# Altium schematic sheet IoT_Uni_Term_Schematic.SchDoc
size A4; SheetNumber: 1; SheetTotal: 1; SPICEModelCachePMUXJGOG: <root> / <DocumentId>PMUXJGOG</DocumentId> / </root>
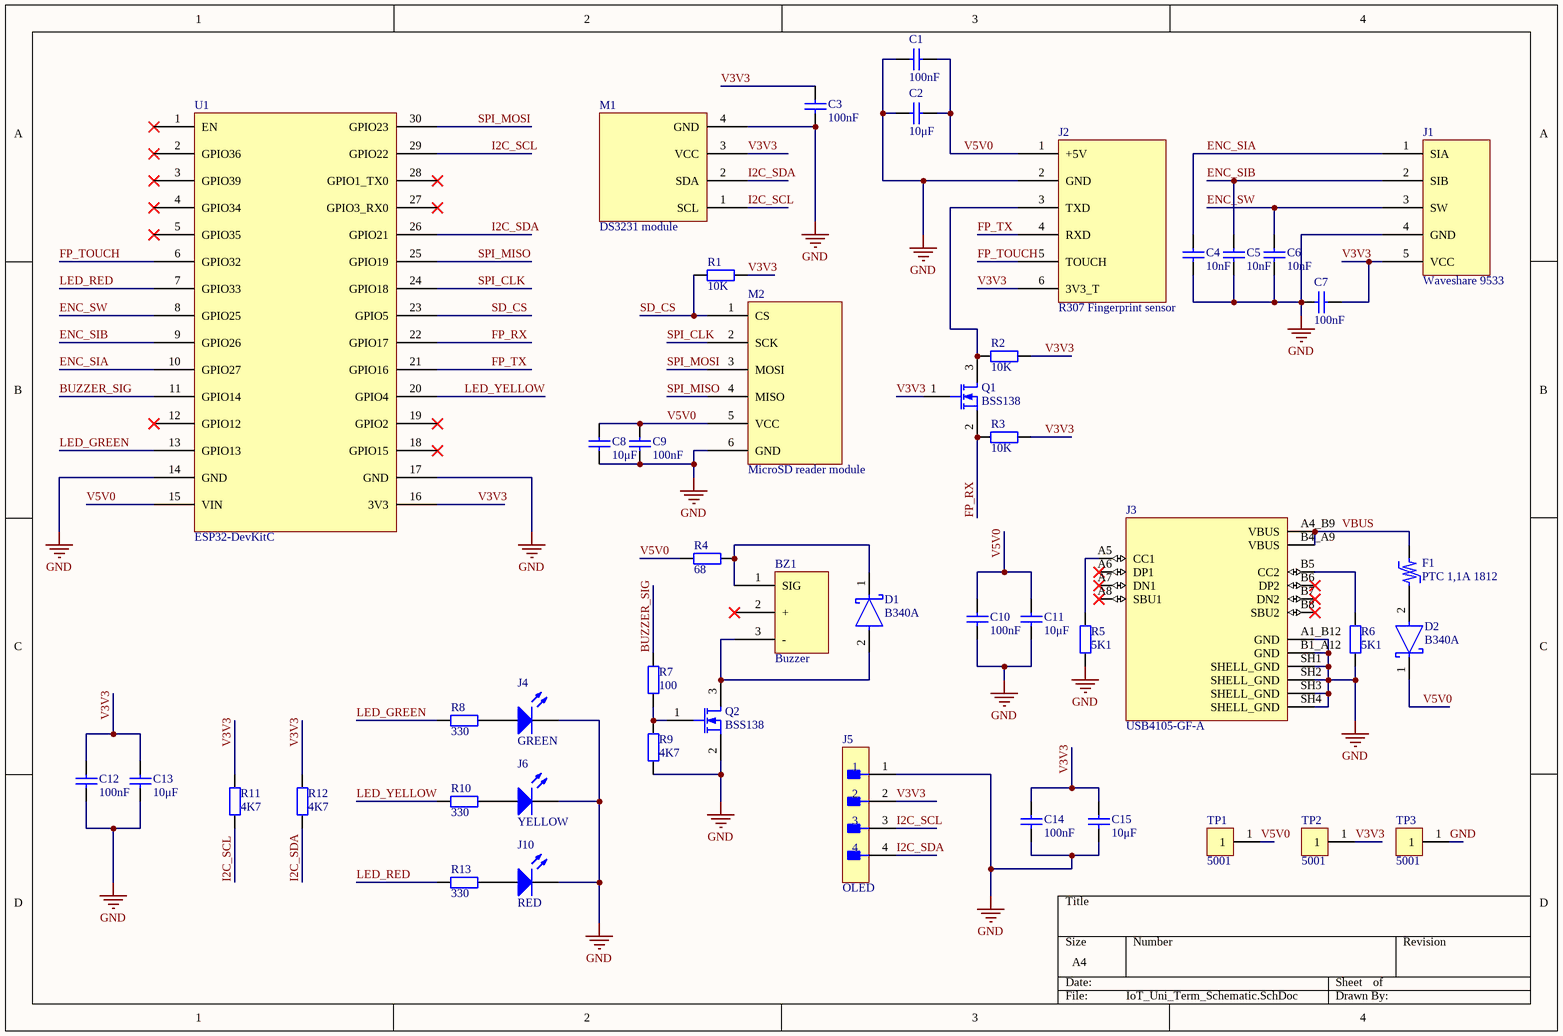
[diagram p0: IoT_Uni_Term_Schematic.SchDoc]

## Parts
BZ1  Buzzer  [BUZZER_HW508]
C1  100nF  [Capacitor_FP-C1206C-EB-IPC_B]
C2  10μF  [Capacitor_FP-C1206C-EB-IPC_B]
C3  100nF  [Capacitor_FP-C1206C-EB-IPC_B]
C4  10nF  [Capacitor_FP-C1206C-EB-IPC_B]
C5  10nF  [Capacitor_FP-C1206C-EB-IPC_B]
C6  10nF  [Capacitor_FP-C1206C-EB-IPC_B]
C7  100nF  [Capacitor_FP-C1206C-EB-IPC_B]
C8  10μF  [Capacitor_FP-C1206C-EB-IPC_B]
C9  100nF  [Capacitor_FP-C1206C-EB-IPC_B]
C10  100nF  [Capacitor_FP-C1206C-EB-IPC_B]
C11  10μF  [Capacitor_FP-C1206C-EB-IPC_B]
C12  100nF  [Capacitor_FP-C1206C-EB-IPC_B]
C13  10μF  [Capacitor_FP-C1206C-EB-IPC_B]
C14  100nF  [Capacitor_FP-C1206C-EB-IPC_B]
C15  10μF  [Capacitor_FP-C1206C-EB-IPC_B]
D1  B340A  [FP-SMA-MFG]
D2  B340A  [FP-SMA-MFG]
F1  PTC 1,1A 1812  [BOUR-MF-MSMF110-24X-2_V]
J1  Waveshare 9533  [FP-B5B-XH-A_LF_SN-MFG]
J2  R307 Fingerprint sensor  [FP-B6B-XH-A_LF_SN-MFG]
J3  USB4105-GF-A  [GCT_USB4105-GF-A]
J4  GREEN  [FP-B2B-XH-A_LF_SN-MFG]
J5  OLED  [FP-B4B-XH-A_LF_SN-MFG]
J6  YELLOW  [FP-B2B-XH-A_LF_SN-MFG]
J10  RED  [FP-B2B-XH-A_LF_SN-MFG]
M1  DS3231 module  [DS3231_MODUL]
M2  MicroSD reader module  [MICROSD_MODUL]
Q1  BSS138  [BSS138]
Q2  BSS138  [BSS138]
R1  10K  [RESISTOR 1206]
R2  10K  [RESISTOR 1206]
R3  10K  [RESISTOR 1206]
R4  68  [RESISTOR 1206]
R5  5K1  [RESISTOR 1206]
R6  5K1  [RESISTOR 1206]
R7  100  [RESISTOR 1206]
R8  330  [RESISTOR 1206]
R9  4K7  [RESISTOR 1206]
R10  330  [RESISTOR 1206]
R11  4K7  [RESISTOR 1206]
R12  4K7  [RESISTOR 1206]
R13  330  [RESISTOR 1206]
TP1  5001  [FP-5001-MFG]
TP2  5001  [FP-5001-MFG]
TP3  5001  [FP-5001-MFG]
U1  ESP32-DevKitC  [ESP32_DevKitC_WROOM-32_15x2PIN]

## Nets
GND: C1.1 C2.1 C3.1 C4.1 C5.1 C6.1 C7.1 C8.1 C9.1 C10.1 C11.1 C12.1 C13.1 C14.1 C15.1 J1.4(GND) J2.2(GND) J3.A1_B12(GND) J3.B1_A12(GND) J3.SH1(SHELL_GND) J3.SH2(SHELL_GND) J3.SH3(SHELL_GND) J3.SH4(SHELL_GND) J4.2(K) J5.1 J6.2(K) J10.2(K) M1.4(GND) M2.6(GND) Q2.2(S) R5.1 R6.1 R9.1 TP3.1 U1.14(GND) U1.17(GND)
BUZZER_SIG: R7.2 U1.11(GPIO14)
ENC_SIA: C4.2 J1.1(SIA) U1.10(GPIO27)
ENC_SIB: C5.2 J1.2(SIB) U1.9(GPIO26)
ENC_SW: C6.2 J1.3(SW) U1.8(GPIO25)
FP_RX: Q1.2(S) R3.1 U1.22(GPIO17)
FP_TOUCH: J2.5(TOUCH) U1.6(GPIO32)
FP_TX: J2.4(RXD) U1.21(GPIO16)
I2C_SCL: J5.3 M1.1(SCL) R11.1 U1.29(GPIO22)
I2C_SDA: J5.4 M1.2(SDA) R12.1 U1.26(GPIO21)
LED_GREEN: R8.2 U1.13(GPIO13)
LED_RED: R13.2 U1.7(GPIO33)
LED_YELLOW: R10.2 U1.20(GPIO4)
SD_CS: M2.1(CS) R1.1 U1.23(GPIO5)
SPI_CLK: M2.2(SCK) U1.24(GPIO18)
SPI_MISO: M2.4(MISO) U1.25(GPIO19)
SPI_MOSI: M2.3(MOSI) U1.30(GPIO23)
V3V3: C3.2 C7.2 C12.2 C13.2 C14.2 C15.2 J1.5(VCC) J2.6(3V3_T) J5.2 M1.3(VCC) Q1.1(G) R1.2 R2.2 R3.2 R11.2 R12.2 TP2.1 U1.16(3V3)
V5V0: C1.2 C2.2 C8.2 C9.2 C10.2 C11.2 D2.1(C) J2.1(+5V) M2.5(VCC) R4.1 TP1.1 U1.15(VIN)
VBUS: F1.1 J3.A4_B9(VBUS) J3.B4_A9(VBUS)
NetBZ1_1: BZ1.1(SIG) D1.1(C) R4.2
NetBZ1_3: BZ1.3(-) D1.2(A) Q2.3(D)
NetD2_2: D2.2(A) F1.2
NetJ2_3: J2.3(TXD) Q1.3(D) R2.1
NetJ3_A5: J3.A5(CC1) R5.2
NetJ3_B5: J3.B5(CC2) R6.2
NetJ4_1: J4.1(A) R8.1
NetJ6_1: J6.1(A) R10.1
NetJ10_1: J10.1(A) R13.1
NetQ2_1: Q2.1(G) R7.1 R9.2

Not connected (* = marked no-connect by the designer): BZ1 2(+)*; J3 A6(DP1)* A7(DN1)* A8(SBU1)* B6(DP2)* B7(DN2)* B8(SBU2)*; U1 1(EN)* 2(GPIO36)* 3(GPIO39)* 4(GPIO34)* 5(GPIO35)* 12(GPIO12)* 18(GPIO15)* 19(GPIO2)* 27(GPIO3_RX0)* 28(GPIO1_TX0)*

## Library data of the parts
BZ1 = Buzzer: positive, negative terminals + input signal
C1-C15 = Cap: Capacitor; Published: 8-Jun-2000; LatestRevisionDate: 17-Jul-2002; LatestRevisionNote: Re-released for DXP Platform.; PackageReference: RAD-0.3; Publisher: Altium Limited; PackageDescription: Radial Cap, Thru-Hole; 2 Leads; 0.3 in Pin Spacing
  C1 C3 C7 C9 C10 C12 C14: Value: 100nF
  C2 C8 C11 C13 C15: Value: 10μF
  C4-C6: Value: 10nF
D1 D2 = CMP-1667-00003-3: DIODE SCHOTTKY 40V 3A SMA; Max Forward Surge Current (Ifsm): 80A; Forward Voltage: 500mV; Polarity: Standard; Max Reverse Current: 500uA; Capacitance: 250pF; Element Configuration: Single; Mount: Surface Mount; Output Current: 3A; Radiation Hardening: No; Width: 2.92mm; Current Rating: 3A; Termination: SMD/SMT; Voltage: 40V; Series: -; Max Operating Temperature: 125°C; Current: 3A; Max Repetitive Reverse Voltage (Vrrm): 40V; Min Operating Temperature: -55°C; REACH SVHC: No SVHC; Number of Pins: 2; Average Rectified Current: 3A; Contact Plating: Tin; RoHS Compliant: Yes; Max Reverse Voltage (DC): 40V; Packaging: Tape and Reel; Height: 2.3mm; Length: 4.6mm; Case/Package: SMA; Weight: 0.002258oz; Peak Non-Repetitive Surge Current: 80A; Package Quantity: 5000; Lead Free: Lead Free; Forward Current: 3A; Voltage Rating (DC): 40V
F1 = CMP-2100-03655-1: PTC Resettable Fuse, 24 V, 1.1 A, -40 to 85 degC, 2-Pin SMD, RoHS, Tape and Reel; Manufacturer: Bourns; Max Current Rating: 20A; Power Dissipation: 800mW; Supply Voltage: 24V; Number of Terminals: 2; Max Operating Temperature: 85degC; Case Code (Metric): 4532; Width: 3.41mm; RoHSCompliant: true; Contact Plating: Gold; Package Reference: MF-MSMF110-24X-2; Min Operating Temperature: -40degC; Packaging: TapeandReel; Mount: SurfaceMount; Case Code (Imperial): 1812; Length: 4.83mm; Height: 1.6mm; Case/Package: 1812; Datasheet URL: http://www.bourns.com/docs/Product-Datasheets/mfmsmf.pdf; Datasheet Version: Rev. AG, 08/2016; Voltage Rating: 24V; REACH SVHC: NoSVHC; Voltage Rating (DC): 24V; Radiation Hardening: No; Package Description: 2-Pin Surface Mount Device, Body 4.6 x 3.24 mm; Manufacturer URL: http://www.bourns.com/
J1 = Waveshare 9533: compact rotary encoder module featuring a built-in button, designed to detect clockwise and anti-clockwise rotation for menu navigation, volume control, or motor positioning
J2 = GROW R307S: optical fingerprint sensor module from Hangzhou Grow Technology Co., Ltd. It features a high-speed DSP processor, flash memory for storage
J3 = USB4105-GF-A: MF: {'manufacturer': u'GCT'}; Package: None; Price: None; Value: *; MP: USB4105-GF-A; Availability: Unavailable
J4 J6 J10 = LED2: Typical RED, GREEN, YELLOW, AMBER GaAs LED; Published: 8-Jun-2000; LatestRevisionDate: 17-Jul-2002; LatestRevisionNote: Re-released for DXP Platform.; PackageVersion: Feb-2002; PackageReference: 3.2X1.6X1.1; Publisher: Altium Limited; PackageDescription: SM LED; 2 Flat Leads
J5 = CMP-17439-000250-1: CONN HEADER VERT 4POS 2.5MM; Number of Contacts: 4; Contact Resistance: 20mR; Voltage Rating: 250V; Max Current Rating: 3A; Gender: Male; Wire/Cable Gauge: 22AWG; Mated Stacking Heights: 9.8mm; Insulation Resistance: 1GR; Orientation: Straight; Contact Type: Male Pin; Contact Finish - Mating: TIN; Series: XH; Max Voltage Rating (AC): 250V; Lead Pitch: 2.5mm; Contact Shape: Square; Insulation Color: Natural; Termination: Solder; Lead Free: Lead Free; Voltage Rating (AC): 250V; Number of Rows: 1; Flammability Rating: UL94 V-0; Number of Positions: 4; Max Operating Temperature: 85°C; Package Quantity: 500; Mount: Through Hole; REACH SVHC: No SVHC; Connector Type: Header; Insulation Material: Nylon; Fastening Type: Detent; Min Operating Temperature: -25°C; Housing Color: White; Packaging: Bulk; Contact Plating: Tin; Contact Material: Brass; Max Voltage Rating (DC): 250V; Housing Material: Polyamide; Color: Natural; Material: Polyamide; Pitch: 2.5mm; Depth: 5.75mm; Current Rating: 3A; Length: 12.4mm
M2 = microSD Card module: SPI INTERFACE, 2.54mm, 3.3V - 5.0V
Q1 Q2 = MOSFET-N: N-Channel MOSFET; Published: 8-Jun-2000; LatestRevisionDate: 17-Jul-2002; LatestRevisionNote: Re-released for DXP Platform.; PackageVersion: 1995/1996; PackageReference: E3; Publisher: Altium Limited; PackageDescription: TO, Flat Index; 3 In-Line, Axial Leads; Body Dia. 4.6mm; Lead Dia. 0.5 mm (max)
R1-R13 = Res2: Resistor; Published: 8-Jun-2000; LatestRevisionDate: 17-Jul-2002; LatestRevisionNote: Re-released for DXP Platform.; PackageReference: AXIAL-0.4; Publisher: Altium Limited; PackageDescription: Axial Device, Thru-Hole; 2 Leads; 0.4 in Pin Spacing
  R1-R3: Value: 10K
  R4: Value: 68
  R5 R6: Value: 5K1
  R7: Value: 100
  R8 R10 R13: Value: 330
  R9 R11 R12: Value: 4K7
TP1-TP3 = CMP-2000-05181-2: PC TEST POINT MINIATURE BLACK; Body Material: Bronze; Plating: Silver; Inside Diameter: 1.27mm; Hole Diameter: 1.6mm; Number of Ports: 1; Outside Diameter: 2.54mm; Insulation: Insulated; Insulation Material: Nylon; Mount: Through Hole; RoHS Compliant: Yes; Series: THM; Height: 0.3inch; Termination: Through Hole; Material: Nylon; Packaging: Bulk; Contact Material: Bronze; REACH SVHC: No SVHC; Contact Plating: Silver; Orientation: Straight; Lead Free: Lead Free; Package Quantity: 100; Length: 7.62mm; Flammability Rating: UL94 V-0; Number of Contacts: 1; Diameter: 2.54mm; Housing Color: Black; Color: Black
U1 = ESP32-DevKitC: Płytka rozwojowa z układem ESP32, 30 wyprowadzeń, mostek CP2102, stabilizator AMS1117-3.3